# Altium schematic sheet Regs.SchDoc
size A4
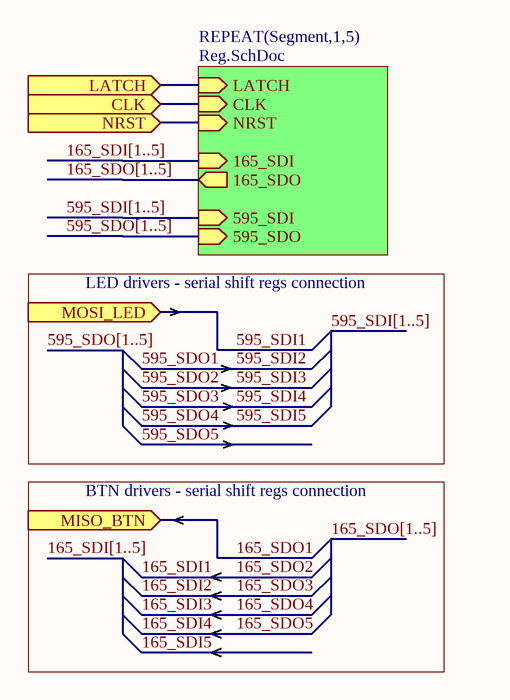
[diagram p0: Regs.SchDoc]

## Sub-sheets
REPEAT(Segment,1,5) = Reg.SchDoc: LATCH (in), CLK (in), 165_SDI (in), 165_SDO (out), NRST (in), 595_SDI (in), 595_SDO (in)

## Ports
CLK (in), LATCH (in), MISO_BTN (in), MOSI_LED (in), NRST (in)

## Nets
165_SDO1: port MISO_BTN
595_SDI1: port MOSI_LED
CLK: port CLK, sheet REPEAT(Segment,1,5)/CLK
LATCH: port LATCH, sheet REPEAT(Segment,1,5)/LATCH
NRST: port NRST, sheet REPEAT(Segment,1,5)/NRST

## Buses and harness runs
bus 165_SDI[1..5]
bus 165_SDO[1..5]
bus 595_SDI[1..5]
bus 595_SDO[1..5]

## Notes on the sheet
- LED drivers - serial shift regs connection
- BTN drivers - serial shift regs connection